# Altium schematic sheet Button_Sheet.SchDoc
size A; SheetNumber: 11; SheetTotal: 11
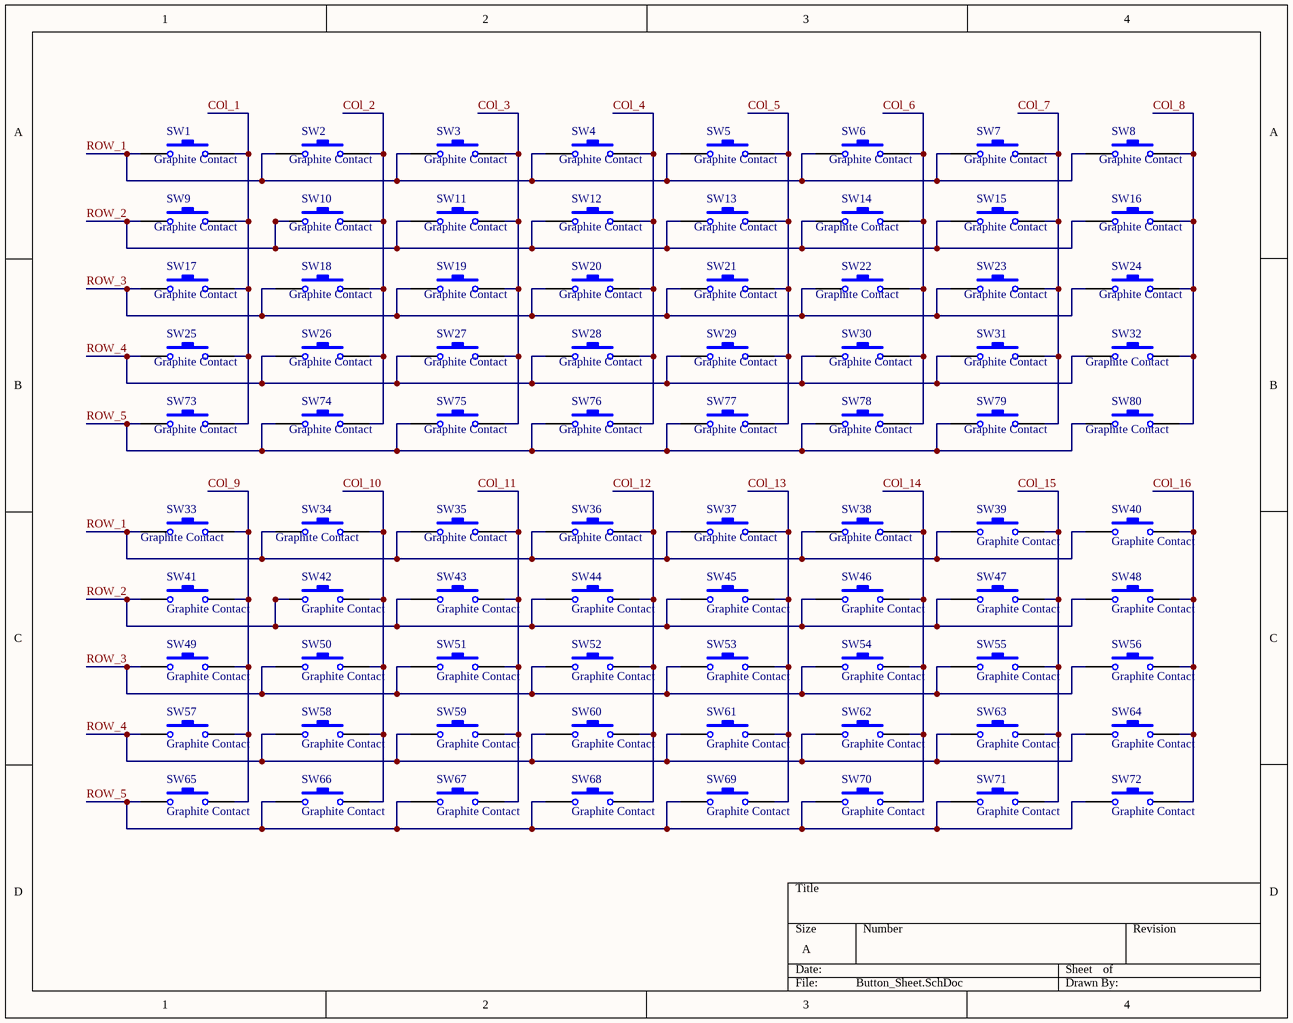
[diagram p0: Button_Sheet.SchDoc]

## Parts
SW1  Graphite Contact  [Graphite Contact]
SW2  Graphite Contact  [Graphite Contact]
SW3  Graphite Contact  [Graphite Contact]
SW4  Graphite Contact  [Graphite Contact]
SW5  Graphite Contact  [Graphite Contact]
SW6  Graphite Contact  [Graphite Contact]
SW7  Graphite Contact  [Graphite Contact]
SW8  Graphite Contact  [Graphite Contact]
SW9  Graphite Contact  [Graphite Contact]
SW10  Graphite Contact  [Graphite Contact]
SW11  Graphite Contact  [Graphite Contact]
SW12  Graphite Contact  [Graphite Contact]
SW13  Graphite Contact  [Graphite Contact]
SW14  Graphite Contact  [Graphite Contact]
SW15  Graphite Contact  [Graphite Contact]
SW16  Graphite Contact  [Graphite Contact]
SW17  Graphite Contact  [Graphite Contact]
SW18  Graphite Contact  [Graphite Contact]
SW19  Graphite Contact  [Graphite Contact]
SW20  Graphite Contact  [Graphite Contact]
SW21  Graphite Contact  [Graphite Contact]
SW22  Graphite Contact  [Graphite Contact]
SW23  Graphite Contact  [Graphite Contact]
SW24  Graphite Contact  [Graphite Contact]
SW25  Graphite Contact  [Graphite Contact]
SW26  Graphite Contact  [Graphite Contact]
SW27  Graphite Contact  [Graphite Contact]
SW28  Graphite Contact  [Graphite Contact]
SW29  Graphite Contact  [Graphite Contact]
SW30  Graphite Contact  [Graphite Contact]
SW31  Graphite Contact  [Graphite Contact]
SW32  Graphite Contact  [Graphite Contact]
SW33  Graphite Contact  [Graphite Contact]
SW34  Graphite Contact  [Graphite Contact]
SW35  Graphite Contact  [Graphite Contact]
SW36  Graphite Contact  [Graphite Contact]
SW37  Graphite Contact  [Graphite Contact]
SW38  Graphite Contact  [Graphite Contact]
SW39  Graphite Contact  [Graphite Contact]
SW40  Graphite Contact  [Graphite Contact]
SW41  Graphite Contact  [Graphite Contact]
SW42  Graphite Contact  [Graphite Contact]
SW43  Graphite Contact  [Graphite Contact]
SW44  Graphite Contact  [Graphite Contact]
SW45  Graphite Contact  [Graphite Contact]
SW46  Graphite Contact  [Graphite Contact]
SW47  Graphite Contact  [Graphite Contact]
SW48  Graphite Contact  [Graphite Contact]
SW49  Graphite Contact  [Graphite Contact]
SW50  Graphite Contact  [Graphite Contact]
SW51  Graphite Contact  [Graphite Contact]
SW52  Graphite Contact  [Graphite Contact]
SW53  Graphite Contact  [Graphite Contact]
SW54  Graphite Contact  [Graphite Contact]
SW55  Graphite Contact  [Graphite Contact]
SW56  Graphite Contact  [Graphite Contact]
SW57  Graphite Contact  [Graphite Contact]
SW58  Graphite Contact  [Graphite Contact]
SW59  Graphite Contact  [Graphite Contact]
SW60  Graphite Contact  [Graphite Contact]
SW61  Graphite Contact  [Graphite Contact]
SW62  Graphite Contact  [Graphite Contact]
SW63  Graphite Contact  [Graphite Contact]
SW64  Graphite Contact  [Graphite Contact]
SW65  Graphite Contact  [Graphite Contact]
SW66  Graphite Contact  [Graphite Contact]
SW67  Graphite Contact  [Graphite Contact]
SW68  Graphite Contact  [Graphite Contact]
SW69  Graphite Contact  [Graphite Contact]
SW70  Graphite Contact  [Graphite Contact]
SW71  Graphite Contact  [Graphite Contact]
SW72  Graphite Contact  [Graphite Contact]
SW73  Graphite Contact  [Graphite Contact]
SW74  Graphite Contact  [Graphite Contact]
SW75  Graphite Contact  [Graphite Contact]
SW76  Graphite Contact  [Graphite Contact]
SW77  Graphite Contact  [Graphite Contact]
SW78  Graphite Contact  [Graphite Contact]
SW79  Graphite Contact  [Graphite Contact]
SW80  Graphite Contact  [Graphite Contact]

## Nets
COl_1: SW1.2 SW9.2 SW17.2 SW25.2 SW73.2
COl_2: SW2.2 SW10.2 SW18.2 SW26.2 SW74.2
COl_3: SW3.2 SW11.2 SW19.2 SW27.2 SW75.2
COl_4: SW4.2 SW12.2 SW20.2 SW28.2 SW76.2
COl_5: SW5.2 SW13.2 SW21.2 SW29.2 SW77.2
COl_6: SW6.2 SW14.2 SW22.2 SW30.2 SW78.2
COl_7: SW7.2 SW15.2 SW23.2 SW31.2 SW79.2
COl_8: SW8.2 SW16.2 SW24.2 SW32.2 SW80.2
COl_9: SW33.2 SW41.2 SW49.2 SW57.2 SW65.2
COl_10: SW34.2 SW42.2 SW50.2 SW58.2 SW66.2
COl_11: SW35.2 SW43.2 SW51.2 SW59.2 SW67.2
COl_12: SW36.2 SW44.2 SW52.2 SW60.2 SW68.2
COl_13: SW37.2 SW45.2 SW53.2 SW61.2 SW69.2
COl_14: SW38.2 SW46.2 SW54.2 SW62.2 SW70.2
COl_15: SW39.2 SW47.2 SW55.2 SW63.2 SW71.2
COl_16: SW40.2 SW48.2 SW56.2 SW64.2 SW72.2
ROW_1: SW1.1 SW2.1 SW3.1 SW4.1 SW5.1 SW6.1 SW7.1 SW8.1 SW33.1 SW34.1 SW35.1 SW36.1 SW37.1 SW38.1 SW39.1 SW40.1
ROW_2: SW9.1 SW10.1 SW11.1 SW12.1 SW13.1 SW14.1 SW15.1 SW16.1 SW41.1 SW42.1 SW43.1 SW44.1 SW45.1 SW46.1 SW47.1 SW48.1
ROW_3: SW17.1 SW18.1 SW19.1 SW20.1 SW21.1 SW22.1 SW23.1 SW24.1 SW49.1 SW50.1 SW51.1 SW52.1 SW53.1 SW54.1 SW55.1 SW56.1
ROW_4: SW25.1 SW26.1 SW27.1 SW28.1 SW29.1 SW30.1 SW31.1 SW32.1 SW57.1 SW58.1 SW59.1 SW60.1 SW61.1 SW62.1 SW63.1 SW64.1
ROW_5: SW65.1 SW66.1 SW67.1 SW68.1 SW69.1 SW70.1 SW71.1 SW72.1 SW73.1 SW74.1 SW75.1 SW76.1 SW77.1 SW78.1 SW79.1 SW80.1

## Library data of the parts
SW1-SW80 = Graphite Contact: Push Button for Graphite Contact